# Altium schematic sheet DEBUG.SchDoc
size A4; SheetNumber: 1; SheetTotal: 3
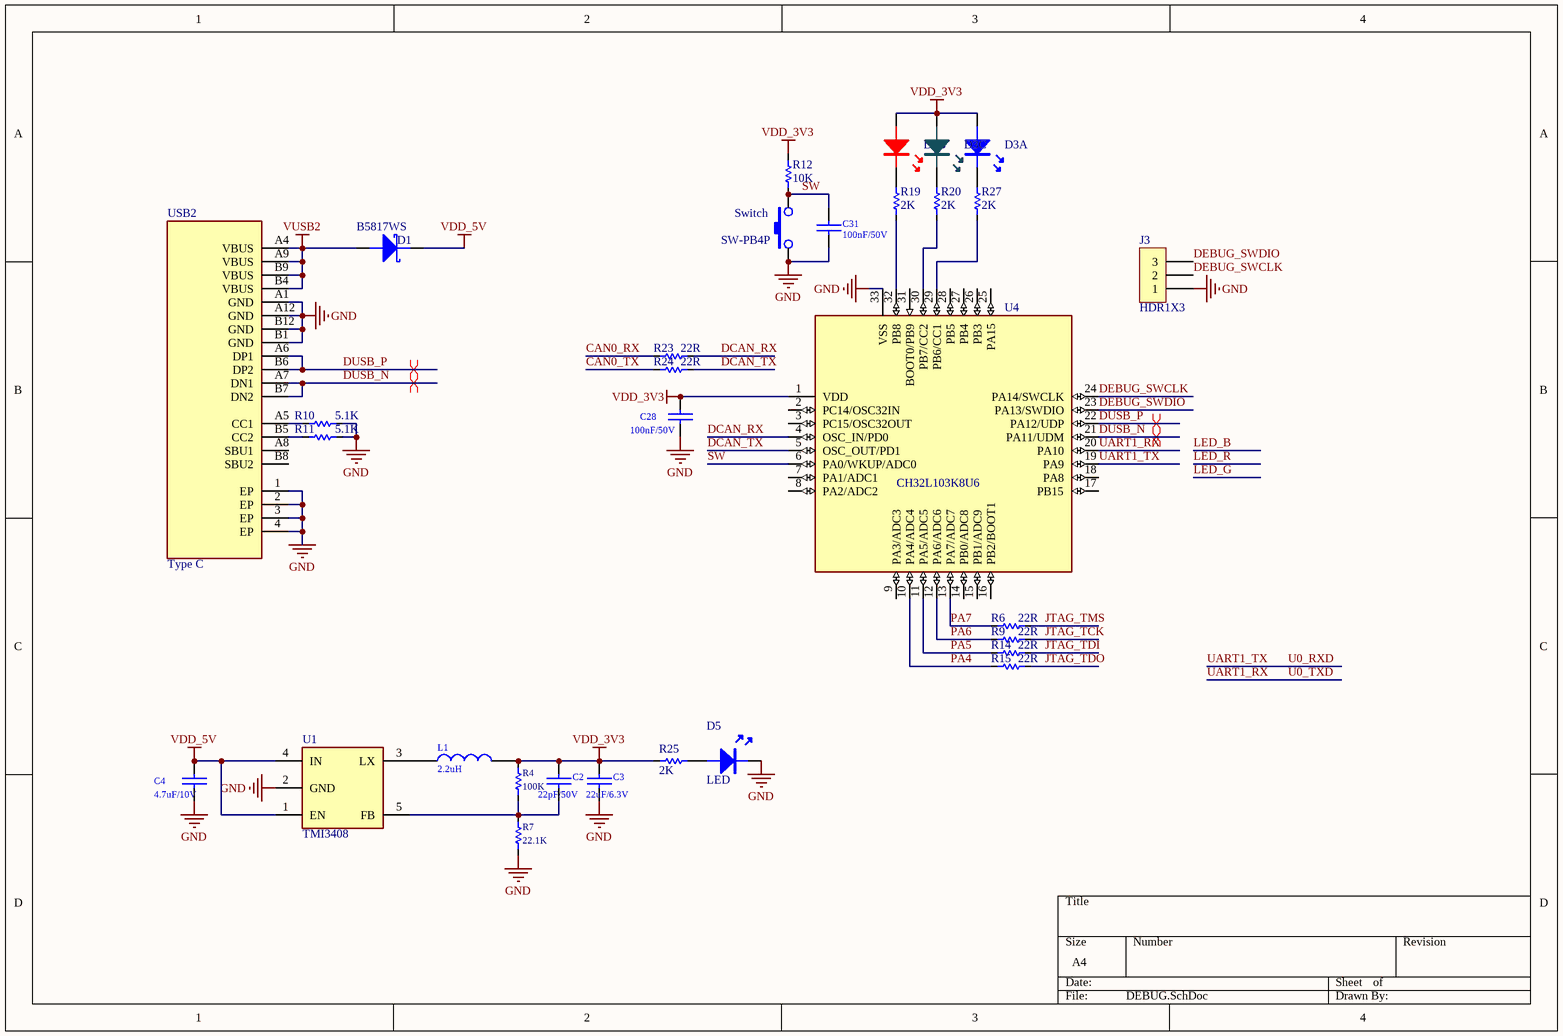
[diagram p0: DEBUG.SchDoc]

## Parts
C2  22pF/50V  [C0402]
C3  22uF/6.3V  [C0603]
C4  4.7uF/10V  [C0402]
C28  100nF/50V  [C0402]
C31  100nF/50V  [C0402]
D1  B5817WS  [SOD-323]
D3  LED  [SMD_4P-L2.2-W2.1-BR]  (value not drawn)  (parts A,B,C of 3)
D5  LED  [LED0402 GREEN]
J3  HDR1X3  [1.27-3PIN]
L1  2.2uH  [L0603]
R4  100K  [R0402]
R6  22R  [R0402]
R7  22.1K  [R0402]
R9  22R  [R0402]
R10  5.1K  [R0402]
R11  5.1K  [R0402]
R12  10K  [R0402]
R14  22R  [R0402]
R15  22R  [R0402]
R19  2K  [R0402]
R20  2K  [R0402]
R23  22R  [R0402]
R24  22R  [R0402]
R25  2K  [R0402]
R27  2K  [R0402]
Switch  SW-PB4P  [SW-PB4P]
U1  TMI3408  [SOT-23-5]
U4  CH32L103K8U6  [QFN32_4*4]
USB2  Type C  [TYPE-C-16PIN-CB1.6]

## Nets
GND: C3.2 C4.2 C28.2 C31.1 D5.K J3.1 R7.2 R10.1 R11.1 Switch.1 Switch.2 U1.2(GND) U4.33(VSS) USB2.1(EP) USB2.2(EP) USB2.3(EP) USB2.4(EP) USB2.A1(GND) USB2.A12(GND) USB2.B1(GND) USB2.B12(GND)
VDD_3V3: C2.1 C3.1 C28.1 D3.1 L1.2 R4.1 R12.1 R25.2 U4.1(VDD)
VDD_5V: C4.1 D1.K U1.1(EN) U1.4(IN)
VUSB2: D1.A USB2.A4(VBUS) USB2.A9(VBUS) USB2.B4(VBUS) USB2.B9(VBUS)
CAN0_RX: R23.2
CAN0_TX: R24.2
DCAN_RX: R23.1 U4.4(OSC_IN/PD0)
DCAN_TX: R24.1 U4.5(OSC_OUT/PD1)
DEBUG_SWCLK: J3.2 U4.24(PA14/SWCLK)
DEBUG_SWDIO: J3.3 U4.23(PA13/SWDIO)
DUSB_N: U4.21(PA11/UDM) USB2.A7(DN1) USB2.B7(DN2)
DUSB_P: U4.22(PA12/UDP) USB2.A6(DP1) USB2.B6(DP2)
JTAG_TCK: R9.1
JTAG_TDI: R14.1
JTAG_TDO: R15.1
JTAG_TMS: R6.1
PA4: R15.2 U4.10(PA4/ADC4)
PA5: R14.2 U4.11(PA5/ADC5)
PA6: R9.2 U4.12(PA6/ADC6)
PA7: R6.2 U4.13(PA7/ADC7)
SW: C31.2 R12.2 Switch.3 Switch.4 U4.6(PA0/WKUP/ADC0)
U0_RXD: U4.19(PA9)  [also labelled UART1_TX]
U0_TXD: U4.20(PA10)  [also labelled UART1_RX]
NetC2_2: C2.2 R4.2 R7.1 U1.5(FB)
NetD3_2: D3.2 R19.2
NetD3_3: D3.3 R20.2
NetD3_4: D3.4 R27.2
NetD5_A: D5.A R25.1
NetL1_1: L1.1 U1.3(LX)
NetR10_2: R10.2 USB2.A5(CC1)
NetR11_2: R11.2 USB2.B5(CC2)
NetR19_1: R19.1 U4.32(PB8)
NetR20_1: R20.1 U4.30(PB7/CC2)
NetR27_1: R27.1 U4.29(PB6/CC1)

Not connected (* = marked no-connect by the designer): U4 2(PC14/OSC32IN) 3(PC15/OSC32OUT) 7(PA1/ADC1) 8(PA2/ADC2) 9(PA3/ADC3) 14(PB0/ADC8) 15(PB1/ADC9) 16(PB2/BOOT1) 17(PB15) 18(PA8) 25(PA15) 26(PB3) 27(PB4) 28(PB5) 31(BOOT0/PB9); USB2 A8(SBU1) B8(SBU2)

## Layout directives
differential pair: DUSB_N, DUSB_P

## Library data of the parts
C2 = Cap: Capacitor; Manufacturer: FH(风华); PreferredModel: 0402CG220J500NT; Name: Capacitance; WeldingType: SMD; JLC-Code: C1555
C3 = Cap: Capacitor; Manufacturer: FH(风华); PreferredModel: 0603X226M6R3NT; Name: Capacitance; WeldingType: SMD; JLC-Code: C94018
C4 = Cap: Capacitor; Manufacturer: SAMSUNG; PreferredModel: CL05A475KP5NRNC; Name: Capacitance; WeldingType: SMD; JLC-Code: C368809
C28 C31 = Cap: Capacitor; Manufacturer: SAMSUNG(三星); PreferredModel: CL05B104KB54PNC; Name: Capacitance; WeldingType: SMD; JLC-Code: C307331
D1 = Schottky Diode: Manufacturer: R+O(宏嘉诚); WeldingType: SMD; PreferredModel: B5817WS; Name: Schottky Diode; InternalNumbering: *; JLC-Code: C7420329
D3 = LED_RGB: WeldingType: SMD; PreferredModel: *; Name: LED; Manufacturer: *; InternalNumbering: *; JLC-Code: *
D5 = LED: WeldingType: SMD; PreferredModel: *; Name: LED; Manufacturer: *; InternalNumbering: *; JLC-Code: *
L1 = Inductors: Manufacturer: ZE(增益); PreferredModel: ZEMS160808-2R2M; WeldingType: SMD; Name: Inductors; JLC-Code: C48944989
R4 = Res: Resistance; Manufacturer: UNI-ROYAL(厚声); PreferredModel: 0402WGF1003TCE; WeldingType: SMD; Name: Resistance; JLC-Code: C25741
R6 R9 R14 R15 R23 R24 = Res: Resistance; Manufacturer: UNI-ROYAL(厚声); PreferredModel: 0402WGF220JTCE; WeldingType: SMD; Name: Resistance; JLC-Code: C25092
R7 = Res: Resistance; Manufacturer: UNI-ROYAL(厚声); PreferredModel: 0402WGF2212TCE; WeldingType: SMD; Name: Resistance; JLC-Code: C43473
R10-R12 R19 R20 R25 R27 = Res: Resistance; WeldingType: SMD; Name: Resistance; JLC-Code: *
Switch = SW-PB4P: Manufacturer: DEALON(德艺隆); PreferredModel: TD-1221SR-2.5H-250; Name: Switch; WeldingType: SMD; InternalNumbering: *; JLC-Code: C2905184
U1 = SM8082AAAC: Integrated Circuit; Manufacturer: silergy; Name: LDO; WeldingType: SMD; PreferredModel: SM8082AAAC; JLC-Code: *
U4 = CH32L103K8U6: RISC-V MCU; Manufacturer: WCH; WeldingType: SMD; PreferredModel: CH32L103K8U6; Name: MCU; JLC-Code: *
USB2 = Type C: USB Type C; WeldingType: SMD; PreferredModel: *; Name: USB Type C; Manufacturer: *; InternalNumbering: *; JLC-Code: *